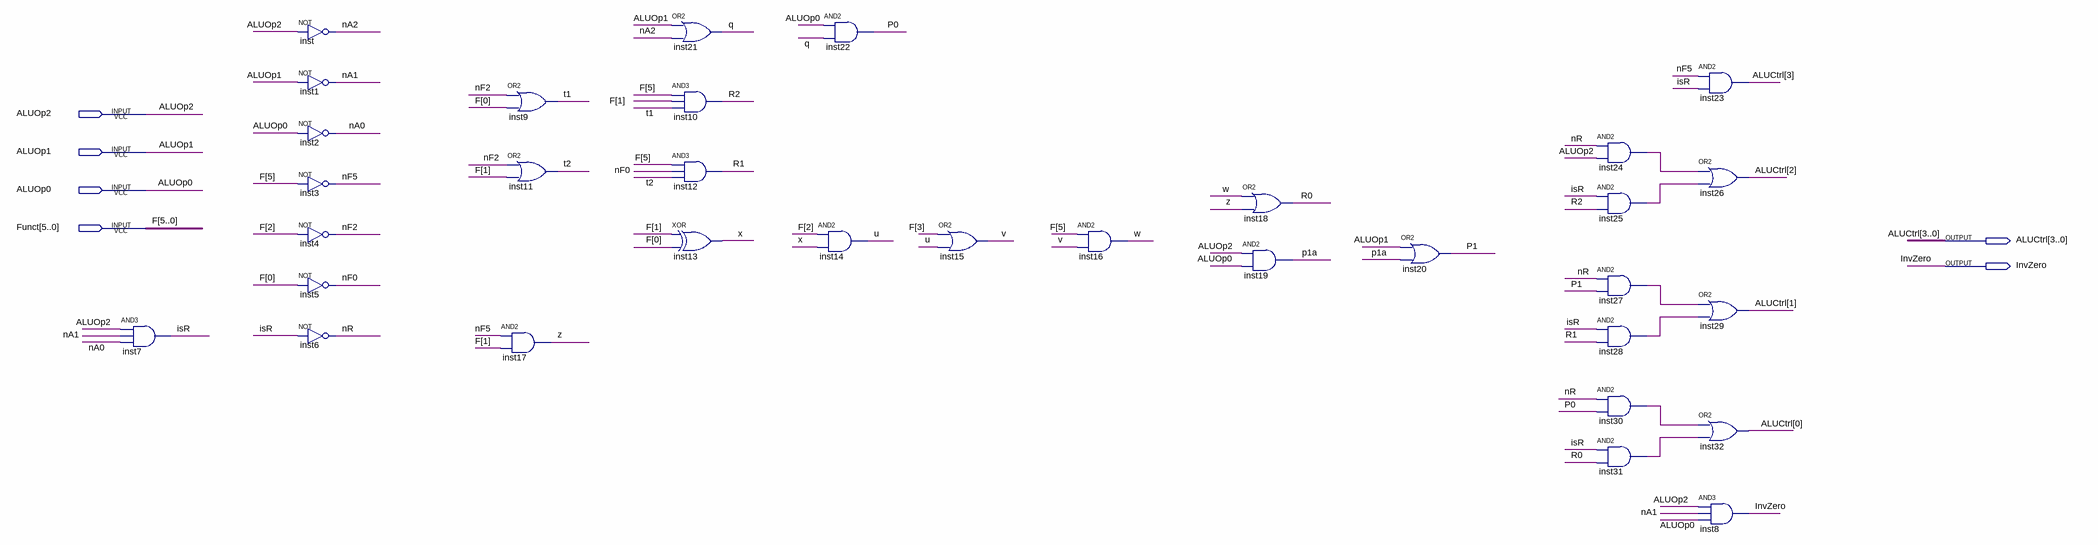
[diagram p0: schematic sheet]
// Quartus schematic ALUControl.bdf as structural Verilog: 33 symbols, 6 pins
module ALUControl (
  input  ALUOp2,
  input  ALUOp1,
  input  ALUOp0,
  input  [5:0] Funct,
  output [3:0] ALUCtrl,
  output InvZero
);

  wire inst24_out, inst25_out, inst27_out, inst28_out, inst30_out, inst31_out, isR, nA0, nA1, nA2, nF0, nF2,
       nF5, nR, P0, P1, p1a, q, R0, R1, R2, t1, t2, u, v, w, x, z;

  and inst7 (isR, ALUOp2, nA1, nA0);
  not inst (nA2, ALUOp2);
  not inst1 (nA1, ALUOp1);
  not inst2 (nA0, ALUOp0);
  not inst3 (nF5, Funct[5]);
  not inst4 (nF2, Funct[2]);
  not inst5 (nF0, Funct[0]);
  not inst6 (nR, isR);
  or inst9 (t1, nF2, Funct[0]);
  or inst11 (t2, nF2, Funct[1]);
  and inst17 (z, nF5, Funct[1]);
  or inst21 (q, ALUOp1, nA2);
  and inst10 (R2, Funct[5], Funct[1], t1);
  and inst12 (R1, Funct[5], nF0, t2);
  xor inst13 (x, Funct[1], Funct[0]);
  and inst22 (P0, ALUOp0, q);
  and inst14 (u, Funct[2], x);
  or inst15 (v, Funct[3], u);
  and inst16 (w, Funct[5], v);
  or inst18 (R0, w, z);
  and inst19 (p1a, ALUOp2, ALUOp0);
  or inst20 (P1, ALUOp1, p1a);
  and inst24 (inst24_out, nR, ALUOp2);
  and inst25 (inst25_out, isR, R2);
  and inst27 (inst27_out, nR, P1);
  and inst28 (inst28_out, isR, R1);
  and inst30 (inst30_out, nR, P0);
  and inst31 (inst31_out, isR, R0);
  and inst23 (ALUCtrl[3], nF5, isR);
  or inst26 (ALUCtrl[2], inst24_out, inst25_out);
  or inst29 (ALUCtrl[1], inst27_out, inst28_out);
  or inst32 (ALUCtrl[0], inst30_out, inst31_out);
  and inst8 (InvZero, ALUOp2, nA1, ALUOp0);

  // Other names for the same wires on the sheet: F[5:0] = Funct
endmodule
